# Altium schematic sheet 09_KOM_ACB23_4009_Periphery.SchDoc: Periphery
size A4; DocumentNumber: 2023-03-28; Revision: v0.11; SheetNumber: 9; SheetTotal: 9
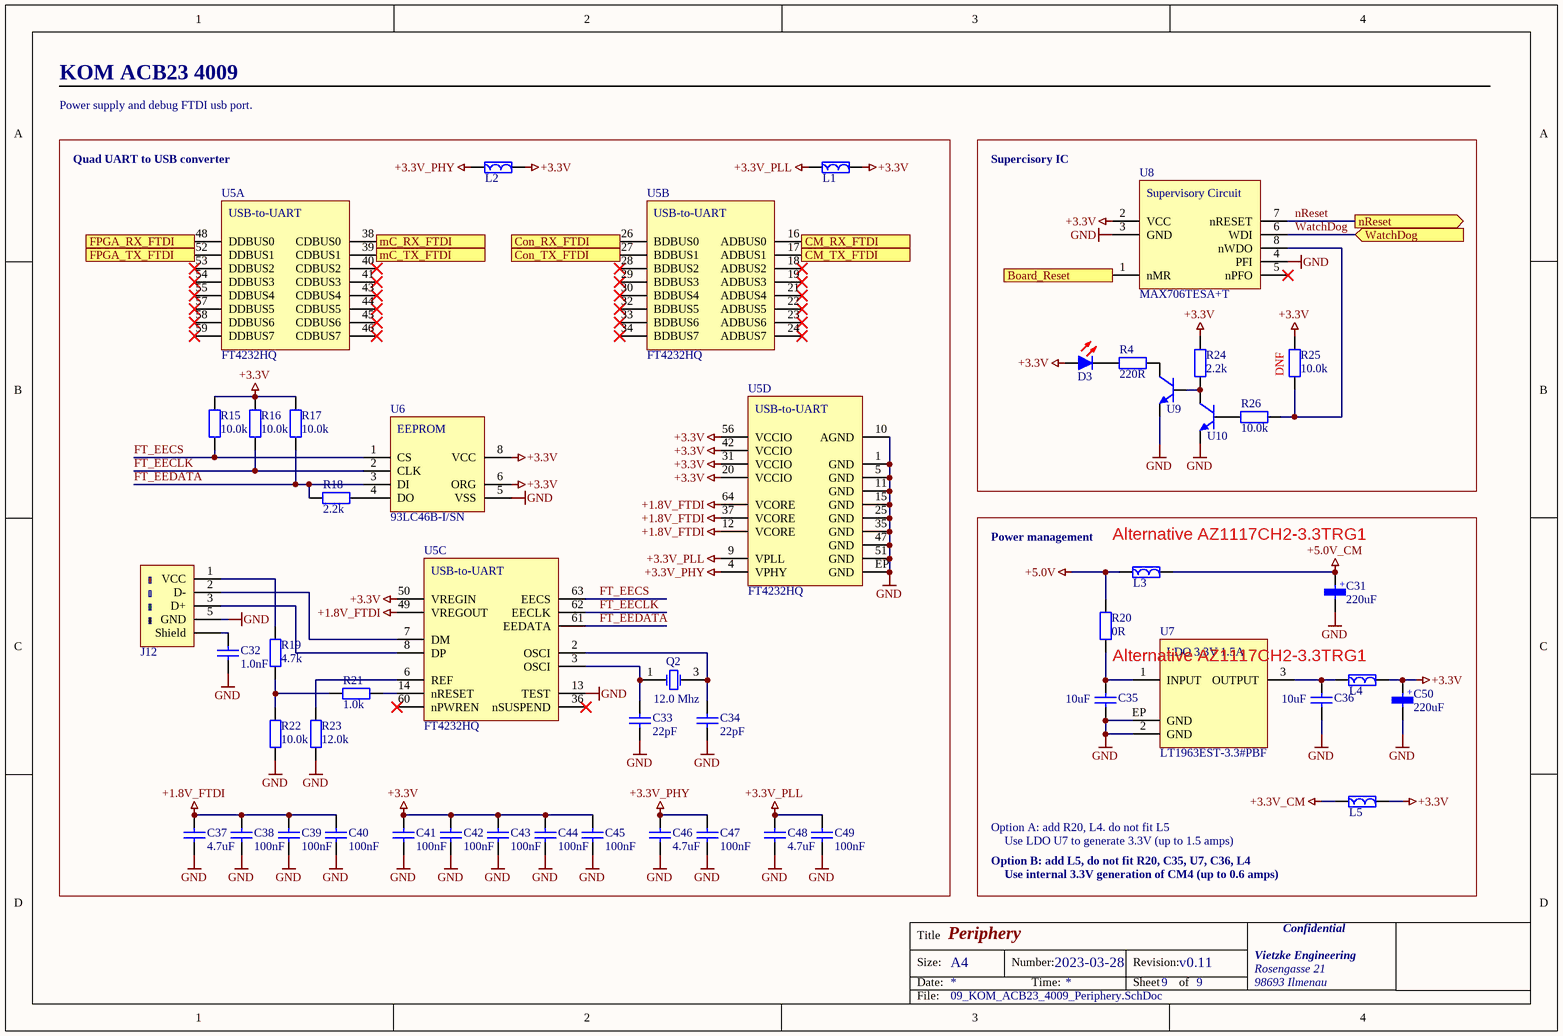
[diagram p0: 09_KOM_ACB23_4009_Periphery.SchDoc]

## Parts
C31  value 220uF  [TANTAL_7343]  (hidden comment: T491D227K010AT)
C32  value 1.0nF  [C1206]  (hidden comment: CC1206KKX7RSBB102)
C33  value 22pF  [C0402]  (hidden comment: C0402C220J4GACAUTO)
C34  value 22pF  [C0402]  (hidden comment: C0402C220J4GACAUTO)
C35  value 10uF  [C0603]  (hidden comment: JMK107BJ106MA-T)
C36  value 10uF  [C0603]  (hidden comment: JMK107BJ106MA-T)
C37  value 4.7uF  [C0402]  (hidden comment: GRM153R60J475ME15D)
C38  value 100nF  [C0402]  (hidden comment: C0402C104K3RACTU)
C39  value 100nF  [C0402]  (hidden comment: C0402C104K3RACTU)
C40  value 100nF  [C0402]  (hidden comment: C0402C104K3RACTU)
C41  value 100nF  [C0402]  (hidden comment: C0402C104K3RACTU)
C42  value 100nF  [C0402]  (hidden comment: C0402C104K3RACTU)
C43  value 100nF  [C0402]  (hidden comment: C0402C104K3RACTU)
C44  value 100nF  [C0402]  (hidden comment: C0402C104K3RACTU)
C45  value 100nF  [C0402]  (hidden comment: C0402C104K3RACTU)
C46  value 4.7uF  [C0402]  (hidden comment: GRM153R60J475ME15D)
C47  value 100nF  [C0402]  (hidden comment: C0402C104K3RACTU)
C48  value 4.7uF  [C0402]  (hidden comment: GRM153R60J475ME15D)
C49  value 100nF  [C0402]  (hidden comment: C0402C104K3RACTU)
C50  value 220uF  [TANTAL_7343]  (hidden comment: T491D227K010AT)
D3  APT1608EC  [LED 0603 RED]  (value not drawn)
J12  651005136421  [USB MiniUSB B Vertical THT]  (value not drawn)
L1  742792651  [L0603]  (value not drawn)
L2  742792651  [L0603]  (value not drawn)
L3  742792514  [L1812]  (value not drawn)
L4  742792651  [L0603]  (value not drawn)
L5  742792651  [L0603]  (value not drawn)
Q2  value 12.0 Mhz  [Crystal_3.2x2.5]  (hidden comment: ABM8W-12.0000MHZ-7-D1X-T3)
R4  value 220R  [R0402]  (hidden comment: RC0402FR-07220RL)
R15  value 10.0k  [R0402]  (hidden comment: RC0402FR-0710KL)
R16  value 10.0k  [R0402]  (hidden comment: RC0402FR-0710KL)
R17  value 10.0k  [R0402]  (hidden comment: RC0402FR-0710KL)
R18  value 2.2k  [R0402]  (hidden comment: RC0402FR-072K2L)
R19  value 4.7k  [R0402]  (hidden comment: RC0402FR-074K7L)
R20  value 0R  [R0402]  (hidden comment: RC0402FR-070RL)
R21  value 1.0k  [R0402]  (hidden comment: RC0402FR-071KL)
R22  value 10.0k  [R0402]  (hidden comment: RC0402FR-0710KL)
R23  value 12.0k  [R0402]  (hidden comment: RC0402FR-0712KL)
R24  value 2.2k  [R0402]  (hidden comment: RC0402FR-072K2L)
R25  value 10.0k  [R0402]  (hidden comment: RC0402FR-0710KL)
R26  value 10.0k  [R0402]  (hidden comment: RC0402FR-0710KL)
U5  FT4232HQ  [QFN64_9x9_0.50]  (parts A,B,C,D of 4)
U6  93LC46B-I/SN  [SOIC-8]
U7  LT1963EST-3.3#PBF  [SOT-223-2]
U8  MAX706TESA+T  [SOIC-8]
U9  BC847C,235  [SOT-23-3]  (value not drawn)
U10  BC847C,235  [SOT-23-3]  (value not drawn)

## Blocks framed on the sheet
Quad UART to USB converter: C32-C34 C37-C49 J12 L1 L2 Q2 R15-R19 R21-R23 U5 U6

## Ports
Board_Reset (in), CM_RX_FTDI (out), CM_TX_FTDI (in), Con_RX_FTDI (out), Con_TX_FTDI (in), FPGA_RX_FTDI (out), FPGA_TX_FTDI (in), mC_RX_FTDI (out), mC_TX_FTDI (in), nReset (out), WatchDog (in)

## Nets
+1.8V_FTDI: C37.2 C38.2 C39.2 C40.2 U5.12(VCORE) U5.37(VCORE) U5.49(VREGOUT) U5.64(VCORE)
+3.3V: C41.2 C42.2 C43.2 C44.2 C45.2 C50.1 D3.1(A) L1.2 L2.2 L4.2 L5.2 R15.2 R16.2 R17.2 R24.2 R25.1 U5.20(VCCIO) U5.31(VCCIO) U5.42(VCCIO) U5.50(VREGIN) U5.56(VCCIO) U6.6(ORG) U6.8(VCC) U8.2(VCC)
+3.3V_CM: L5.1
+3.3V_PHY: C46.2 C47.2 L2.1 U5.4(VPHY)
+3.3V_PLL: C48.2 C49.2 L1.1 U5.9(VPLL)
+5.0V: L3.1 R20.2
+5.0V_CM: C31.1 L3.2
GND: C31.2 C32.2 C33.1 C34.1 C35.1 C36.1 C37.1 C38.1 C39.1 C40.1 C41.1 C42.1 C43.1 C44.1 C45.1 C46.1 C47.1 C48.1 C49.1 C50.2 J12.5(GND) R22.1 R23.1 U5.1(GND) U5.5(GND) U5.10(AGND) U5.11(GND) U5.13(TEST) U5.15(GND) U5.25(GND) U5.35(GND) U5.47(GND) U5.51(GND) U5.EP(GND) U6.5(VSS) U7.2(GND) U7.EP(GND) U8.3(GND) U8.4(PFI) U9.2(E) U10.2(E)
Board_Reset: U8.1(nMR) ; port Board_Reset
CM_RX_FTDI: U5.16(ADBUS0) ; port CM_RX_FTDI
CM_TX_FTDI: U5.17(ADBUS1) ; port CM_TX_FTDI
Con_RX_FTDI: U5.26(BDBUS0) ; port Con_RX_FTDI
Con_TX_FTDI: U5.27(BDBUS1) ; port Con_TX_FTDI
FPGA_RX_FTDI: U5.48(DDBUS0) ; port FPGA_RX_FTDI
FPGA_TX_FTDI: U5.52(DDBUS1) ; port FPGA_TX_FTDI
FT_EECLK: R16.1 U5.62(EECLK) U6.2(CLK)
FT_EECS: R15.1 U5.63(EECS) U6.1(CS)
FT_EEDATA: R17.1 R18.1 U5.61(EEDATA) U6.3(DI)
mC_RX_FTDI: U5.38(CDBUS0) ; port mC_RX_FTDI
mC_TX_FTDI: U5.39(CDBUS1) ; port mC_TX_FTDI
nReset: U8.7(nRESET) ; port nReset
WatchDog: U8.6(WDI) ; port WatchDog
NetC32_1: C32.1 J12.S(Shield)
NetC33_2: C33.2 Q2.1(OSC1) U5.3(OSCI)
NetC34_2: C34.2 Q2.3(OSC2) U5.2(OSCI)
NetC35_2: C35.2 R20.1 U7.1(INPUT)
NetC36_2: C36.2 L4.1 U7.3(OUTPUT)
NetD3_2: D3.2(K) R4.1
NetJ12_1: J12.1(VCC) R19.2
NetJ12_2: J12.2(D-) U5.7(DM)
NetJ12_3: J12.3(D+) U5.8(DP)
NetR4_2: R4.2 U9.3(C)
NetR18_2: R18.2 U6.4(DO)
NetR19_1: R19.1 R21.1 R22.2
NetR21_2: R21.2 U5.14(nRESET)
NetR23_2: R23.2 U5.6(REF)
NetR24_1: R24.1 U9.1(B) U10.3(C)
NetR25_2: R25.2 R26.1 U8.8(nWDO)
NetR26_2: R26.2 U10.1(B)

Not connected (* = marked no-connect by the designer): U5 18(ADBUS2)* 19(ADBUS3)* 21(ADBUS4)* 22(ADBUS5)* 23(ADBUS6)* 24(ADBUS7)* 28(BDBUS2)* 29(BDBUS3)* 30(BDBUS4)* 32(BDBUS5)* 33(BDBUS6)* 34(BDBUS7)* 36(nSUSPEND)* 40(CDBUS2)* 41(CDBUS3)* 43(CDBUS4)* 44(CDBUS5)* 45(CDBUS6)* 46(CDBUS7)* 53(DDBUS2)* 54(DDBUS3)* 55(DDBUS4)* 57(DDBUS5)* 58(DDBUS6)* 59(DDBUS7)* 60(nPWREN)*; U8 5(nPFO)*

## Notes on the sheet
- KOM ACB23 4009
- Power supply and debug FTDI usb port.
- Supercisory IC
- (near R25) DNF
- Power management
- Alternative AZ1117CH2-3.3TRG1
- Option A: add R20, L4. do not fit L5
- Use LDO U7 to generate 3.3V (up to 1.5 amps)
- Option B: add L5, do not fit R20, C35, U7, C36, L4
- Use internal 3.3V generation of CM4 (up to 0.6 amps)
- Title
- Size:
- Date:
- A4
- Number:
- Time:
- Revision:
- Sheet
- of
- Vietzke Engineering
- Rosengasse 21
- 98693 Ilmenau
- Confidential
- File:
- (in symbol 93LC46B-I/SN) EEPROM
- (in symbol FT4232HQ, part A) USB-to-UART
- (in symbol FT4232HQ, part B) USB-to-UART
- (in symbol FT4232HQ, part C) USB-to-UART
- (in symbol FT4232HQ, part D) USB-to-UART
- (in symbol LT1963EST-3.3#PBF) LDO 3.3V 1.5A
- (in symbol MAX706TESA+T) Supervisory Circuit
- (in symbol T491D227K010AT) +

## Library data of the parts
C31 C50 = T491D227K010AT: Tantal 7.3x4.3 220uF 10V; Type: SMD; Package: -; Supplier 1: Mouser; Supplier Part Number 1: 80-T491D227K010
C32 = CC1206KKX7RSBB102: 1206 1nF 2.5kV; Type: SMD; Package: 1206; Supplier 1: Mouser; Supplier Part Number 1: 603-CC1206KKX7RSBB10
C33 C34 = C0402C220J4GACAUTO: 0402 22pF 16V; Type: SMD; Package: 0402; Supplier 1: Mouser; Supplier Part Number 1: 80-C0402C220J4GAUTO
C35 C36 = JMK107BJ106MA-T: 0603 10uF 6.3V; Type: SMD; Package: 0603; Supplier 1: Mouser; Supplier Part Number 1: 963-JMK107BJ106MA-T
C37 C46 C48 = GRM153R60J475ME15D: 0402 4.7uF 6.3V; Type: SMD; Package: 0402; Supplier 1: Mouser; Supplier Part Number 1: 81-GRM153R60J475ME5D
C38-C45 C47 C49 = C0402C104K3RACTU: 0402 100nF 25.0V; Type: SMD; Package: 0402; Supplier 1: Mouser; Supplier Part Number 1: 80-C0402C104K3R
D3 = APT1608EC: SMD LED 0603 RED; Type: SMD; Package: 0603; Supplier 1: Mouser; Supplier Part Number 1: 604-APT1608EC
J12 = 651005136421: MiniUSB B Female Vertical THT; Type: THT; Supplier 1: Mouser; Supplier Part Number 1: 710-651005136421
L1 L2 L4 L5 = 742792651: Ferritperle 1A; Type: SMD; Package: 0603; Supplier 1: Mouser; Supplier Part Number 1: 710-742792651
L3 = 742792514: Ferritperle 3A; Type: SMD; Package: 1812; Supplier 1: Mouser; Supplier Part Number 1: 710-742792514
Q2 = ABM8W-12.0000MHZ-7-D1X-T3: Crystal 12 Mhz 3.2 x 2.5; Type: SMD; Package: 3.2x2.5; Supplier 1: Mouser; Supplier Part Number 1: 815-8W12-7D1XT
R4 = RC0402FR-07220RL: 0402 220R; Type: SMD; Package: 0402; Supplier 1: Mouser; Supplier Part Number 1: 603-RC0402FR-07220RL
R15-R17 R22 R25 R26 = RC0402FR-0710KL: 0402 10.0K; Type: SMD; Package: 0402; Supplier 1: Mouser; Supplier Part Number 1: 603-RC0402FR-0710KL
R18 R24 = RC0402FR-072K2L: 0402 2.2K; Type: SMD; Package: 0402; Supplier 1: Mouser; Supplier Part Number 1: 603-RC0402FR-072K2L
R19 = RC0402FR-074K7L: 0402 4.7K; Type: SMD; Package: 0402; Supplier 1: Mouser; Supplier Part Number 1: 603-RC0402FR-074K7L
R20 = RC0402FR-070RL: 0402 0R; Type: SMD; Package: 0402; Supplier 1: Mouser; Supplier Part Number 1: 603-RC0402FR-070RL
R21 = RC0402FR-071KL: 0402 1.0K; Type: SMD; Package: 0402; Supplier 1: Mouser; Supplier Part Number 1: 603-RC0402FR-071KL
R23 = RC0402FR-0712KL: 0402 12.0K; Type: SMD; Package: 0402; Supplier 1: Mouser; Supplier Part Number 1: 603-RC0402FR-0712KL
U5 = FT4232HQ: USB-IC-Schnittstelle USB to Serial UART QuadPort; Type: SMD; Supplier 1: Mouser; Supplier Part Number 1: 895-FT4232HQ
U6 = 93LC46B-I/SN: 1K Microwire Compatible Serial EEPROM; Type: SMD; Supplier 1: Mouser; Supplier Part Number 1: 579-93LC46BISN
U7 = LT1963EST-3.3#PBF: LDO Spannungs-Regulator 1.5A 3.3V; Package: SOT-223-2; Type: SMD; Supplier 1: Mouser; Supplier Part Number 1: 584-LT1963EST-3.3PBF
U8 = MAX706TESA+T: +3V Voltage Monitoring, Low-Cost μP Supervisory Circuit; Type: SMD; Supplier 1: Mouser; Supplier Part Number 1: 700-MAX706TESAT
U9 U10 = BC847C,235: 45 V, 100 mA NPN general-purpose transistor; Package: SOT23; Type: SMD; Supplier 1: Mouser; Supplier Part Number 1: 771-BC847C235